# Altium schematic sheet Sch02.SchDoc
size A4; SheetNumber: 1; SheetTotal: 1
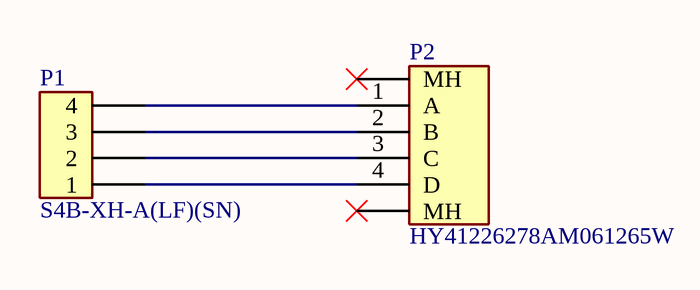
[diagram p0: Sch02.SchDoc]

## Parts
P1  S4B-XH-A(LF)(SN)  [JST_S4B-XH-A(LF)(SN)]
P2  HY41226278AM061265W  [HY41226278AM061265W]

## Nets
NetP1_1: P1.1 P2.4(D)
NetP1_2: P1.2 P2.3(C)
NetP1_3: P1.3 P2.2(B)
NetP1_4: P1.4 P2.1(A)

Not connected (* = marked no-connect by the designer): P2 MH*

## Notes on the sheet
- File:
- Title:
- Date:
- Page
- Num:
- Total:
- Drawn By: Huzaifa Ali

## Library data of the parts
P1 = S4B-XH-A(LF)(SN): Conn Shrouded Header (4 Sides) HDR 4 POS 2.5mm Solder RA Side Entry Thru-Hole Box; MF: J.S.T. Manufacturing Co; SnapEDA_Link: https://www.snapeda.com/parts/S4B-XH-A(LF)(SN)/ACT/view-part/?ref=snap; MP: S4B-XH-A(LF)(SN); Availability: In Stock; Price: None; Value: *; Check_prices: https://www.snapeda.com/parts/S4B-XH-A(LF)(SN)/ACT/view-part/?ref=eda; Package: None
P2 = HY41226278AM061265W: POGO MALE 5-48V/3A